# Altium schematic sheet FPGA_Bank13-14.SchDoc: =DocumentName
size A3; DocumentNumber: 1; Revision: 0; SheetNumber: 19; SheetTotal: 30
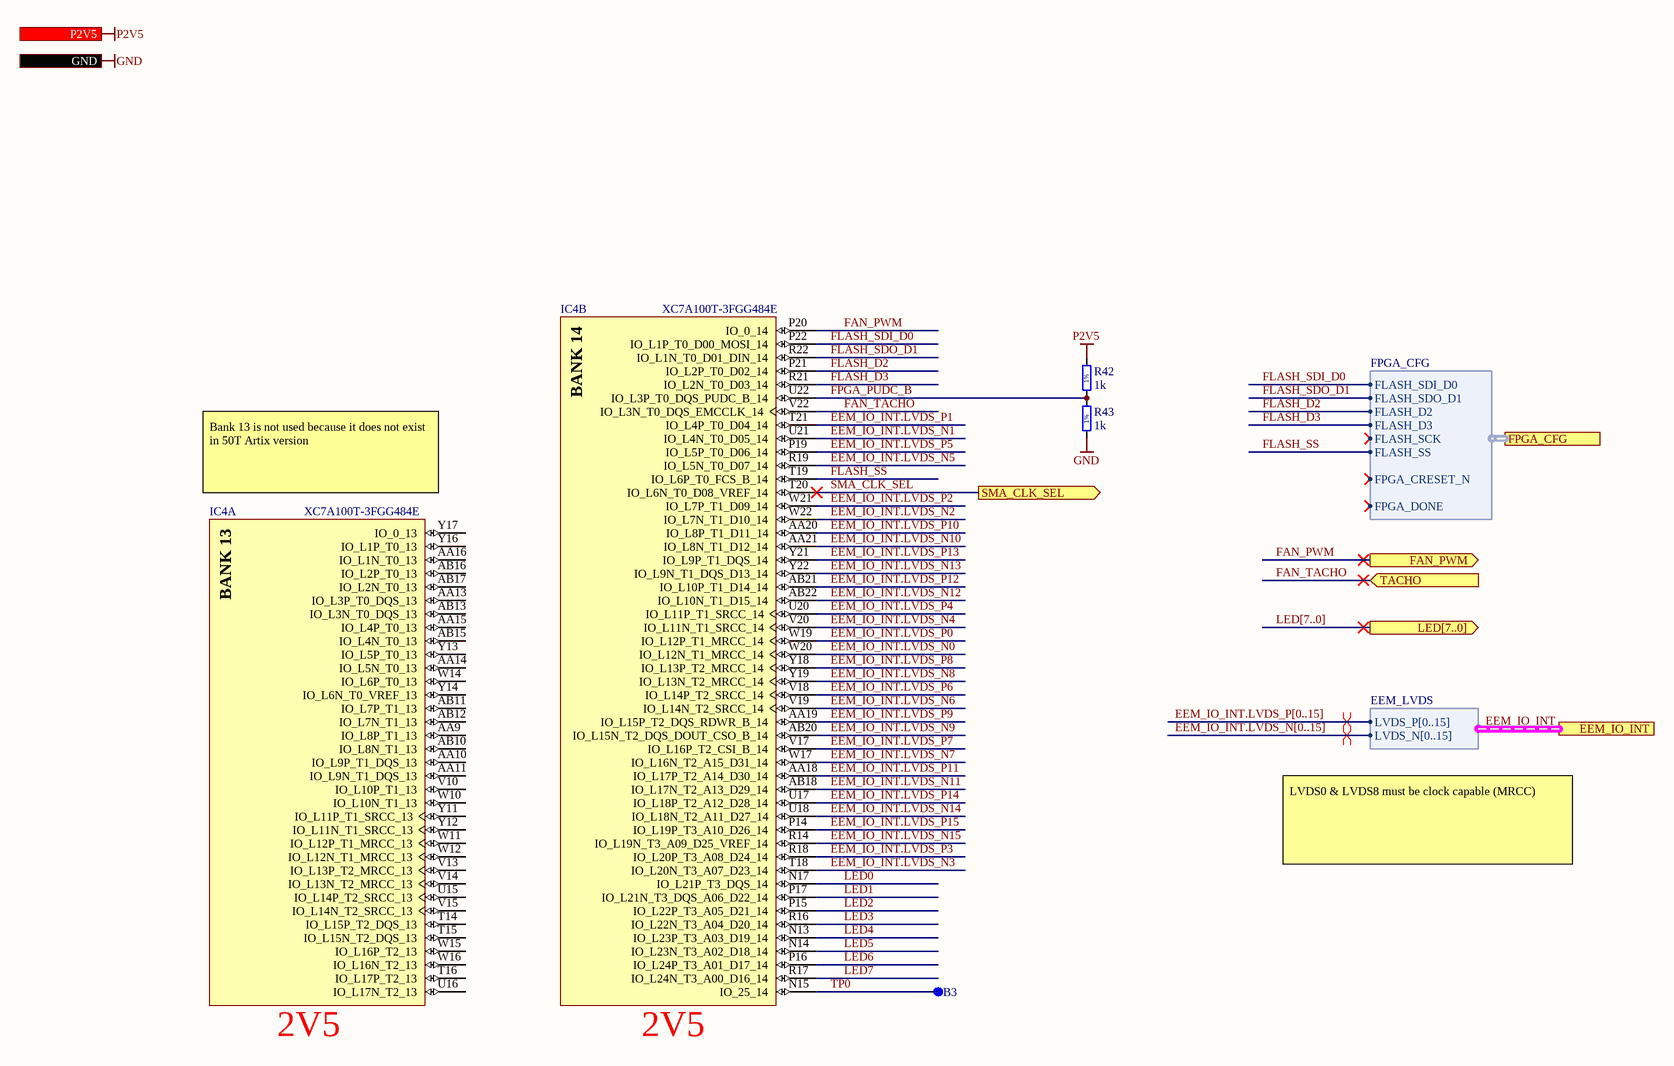
[diagram p0: FPGA_Bank13-14.SchDoc]

## Parts
B3  SMD Pad  [C100]  (value not drawn)
IC4  XC7A100T-3FGG484E  [FGG484]  (parts A,B of 10)
R42  1k  [RESC1005X40N]
R43  1k  [RESC1005X40N]

## Ports
EEM_IO_INT (harness EEM_LVDS), FAN_PWM (out), FPGA_CFG (harness FPGA_CFG), GND, LED[7..0] (out), P2V5 (in), SMA_CLK_SEL (out), TACHO (in)

## Harnesses
EEM_LVDS: LVDS_P[0..15], LVDS_N[0..15]
FPGA_CFG: FLASH_SDI_D0, FLASH_SDO_D1, FLASH_D2, FLASH_D3, FLASH_SCK, FLASH_SS, FPGA_CRESET_N, FPGA_DONE

## Nets
GND: R43.1 ; port GND
P2V5: R42.2 ; port P2V5
EEM_IO_INT.LVDS_N0: IC4.W20(IO_L12N_T1_MRCC_14)
EEM_IO_INT.LVDS_N1: IC4.U21(IO_L4N_T0_D05_14)
EEM_IO_INT.LVDS_N2: IC4.W22(IO_L7N_T1_D10_14)
EEM_IO_INT.LVDS_N3: IC4.T18(IO_L20N_T3_A07_D23_14)
EEM_IO_INT.LVDS_N4: IC4.V20(IO_L11N_T1_SRCC_14)
EEM_IO_INT.LVDS_N5: IC4.R19(IO_L5N_T0_D07_14)
EEM_IO_INT.LVDS_N6: IC4.V19(IO_L14N_T2_SRCC_14)
EEM_IO_INT.LVDS_N7: IC4.W17(IO_L16N_T2_A15_D31_14)
EEM_IO_INT.LVDS_N8: IC4.Y19(IO_L13N_T2_MRCC_14)
EEM_IO_INT.LVDS_N9: IC4.AB20(IO_L15N_T2_DQS_DOUT_CSO_B_14)
EEM_IO_INT.LVDS_N10: IC4.AA21(IO_L8N_T1_D12_14)
EEM_IO_INT.LVDS_N11: IC4.AB18(IO_L17N_T2_A13_D29_14)
EEM_IO_INT.LVDS_N12: IC4.AB22(IO_L10N_T1_D15_14)
EEM_IO_INT.LVDS_N13: IC4.Y22(IO_L9N_T1_DQS_D13_14)
EEM_IO_INT.LVDS_N14: IC4.U18(IO_L18N_T2_A11_D27_14)
EEM_IO_INT.LVDS_N15: IC4.R14(IO_L19N_T3_A09_D25_VREF_14)
EEM_IO_INT.LVDS_P0: IC4.W19(IO_L12P_T1_MRCC_14)
EEM_IO_INT.LVDS_P1: IC4.T21(IO_L4P_T0_D04_14)
EEM_IO_INT.LVDS_P2: IC4.W21(IO_L7P_T1_D09_14)
EEM_IO_INT.LVDS_P3: IC4.R18(IO_L20P_T3_A08_D24_14)
EEM_IO_INT.LVDS_P4: IC4.U20(IO_L11P_T1_SRCC_14)
EEM_IO_INT.LVDS_P5: IC4.P19(IO_L5P_T0_D06_14)
EEM_IO_INT.LVDS_P6: IC4.V18(IO_L14P_T2_SRCC_14)
EEM_IO_INT.LVDS_P7: IC4.V17(IO_L16P_T2_CSI_B_14)
EEM_IO_INT.LVDS_P8: IC4.Y18(IO_L13P_T2_MRCC_14)
EEM_IO_INT.LVDS_P9: IC4.AA19(IO_L15P_T2_DQS_RDWR_B_14)
EEM_IO_INT.LVDS_P10: IC4.AA20(IO_L8P_T1_D11_14)
EEM_IO_INT.LVDS_P11: IC4.AA18(IO_L17P_T2_A14_D30_14)
EEM_IO_INT.LVDS_P12: IC4.AB21(IO_L10P_T1_D14_14)
EEM_IO_INT.LVDS_P13: IC4.Y21(IO_L9P_T1_DQS_14)
EEM_IO_INT.LVDS_P14: IC4.U17(IO_L18P_T2_A12_D28_14)
EEM_IO_INT.LVDS_P15: IC4.P14(IO_L19P_T3_A10_D26_14)
FAN_PWM: IC4.P20(IO_0_14) ; port FAN_PWM
FAN_TACHO: IC4.V22(IO_L3N_T0_DQS_EMCCLK_14) ; port TACHO
FLASH_D2: IC4.P21(IO_L2P_T0_D02_14) ; port FPGA_CFG.FLASH_D2
FLASH_D3: IC4.R21(IO_L2N_T0_D03_14) ; port FPGA_CFG.FLASH_D3
FLASH_SDI_D0: IC4.P22(IO_L1P_T0_D00_MOSI_14) ; port FPGA_CFG.FLASH_SDI_D0
FLASH_SDO_D1: IC4.R22(IO_L1N_T0_D01_DIN_14) ; port FPGA_CFG.FLASH_SDO_D1
FLASH_SS: IC4.T19(IO_L6P_T0_FCS_B_14) ; port FPGA_CFG.FLASH_SS
FPGA_PUDC_B: IC4.U22(IO_L3P_T0_DQS_PUDC_B_14) R42.1 R43.2
LED0: IC4.N17(IO_L21P_T3_DQS_14)
LED1: IC4.P17(IO_L21N_T3_DQS_A06_D22_14)
LED2: IC4.P15(IO_L22P_T3_A05_D21_14)
LED3: IC4.R16(IO_L22N_T3_A04_D20_14)
LED4: IC4.N13(IO_L23P_T3_A03_D19_14)
LED5: IC4.N14(IO_L23N_T3_A02_D18_14)
LED6: IC4.P16(IO_L24P_T3_A01_D17_14)
LED7: IC4.R17(IO_L24N_T3_A00_D16_14)
SMA_CLK_SEL: IC4.T20(IO_L6N_T0_D08_VREF_14) ; port SMA_CLK_SEL
TP0: B3.1 IC4.N15(IO_25_14)

Not connected (* = marked no-connect by the designer): IC4 AA9(IO_L8P_T1_13) AA10(IO_L9P_T1_DQS_13) AA11(IO_L9N_T1_DQS_13) AA13(IO_L3P_T0_DQS_13) AA14(IO_L5N_T0_13) AA15(IO_L4P_T0_13) AA16(IO_L1N_T0_13) AB10(IO_L8N_T1_13) AB11(IO_L7P_T1_13) AB12(IO_L7N_T1_13) AB13(IO_L3N_T0_DQS_13) AB15(IO_L4N_T0_13) AB16(IO_L2P_T0_13) AB17(IO_L2N_T0_13) T14(IO_L15P_T2_DQS_13) T15(IO_L15N_T2_DQS_13) T16(IO_L17P_T2_13) U15(IO_L14P_T2_SRCC_13) U16(IO_L17N_T2_13) V10(IO_L10P_T1_13) V13(IO_L13P_T2_MRCC_13) V14(IO_L13N_T2_MRCC_13) V15(IO_L14N_T2_SRCC_13) W10(IO_L10N_T1_13) W11(IO_L12P_T1_MRCC_13) W12(IO_L12N_T1_MRCC_13) W14(IO_L6P_T0_13) W15(IO_L16P_T2_13) W16(IO_L16N_T2_13) Y11(IO_L11P_T1_SRCC_13) Y12(IO_L11N_T1_SRCC_13) Y13(IO_L5P_T0_13) Y14(IO_L6N_T0_VREF_13) Y16(IO_L1P_T0_13) Y17(IO_0_13)

## Buses and harness runs
bus EEM_IO_INT.LVDS_N[0..15]
bus EEM_IO_INT.LVDS_P[0..15]
bus LED[7..0] = port LED[7..0]
harness EEM_IO_INT = port EEM_IO_INT

## Layout directives
differential pair; differential pair class Diff_100Ohm: (no net found under the mark)

## Notes on the sheet
- (near IC4) Bank 13 is not used because it does not exist in 50T Artix version
- LVDS0 & LVDS8 must be clock capable (MRCC)
- 2V5
- Release
- Last modified =ModifiedDate
  Sheet =sheetnumber of =sheettotal · Size A3
- Copyright =P_copyright_owner
  This source describes Open Hardware and is licensed under the CERN-OHL-W v2. You may redistribute and modify this source and make products using it under the terms of the CERN-OHL-W v2 (https://cern.ch/cern-ohl). This source is distributed WITHOUT ANY EXPRESS OR IMPLIED WARRANTY, INCLUDING OF MERCHANTABILITY, SATISFACTORY QUALITY AND FITNESS FOR A PARTICULAR PURPOSE. Please see the CERN-OHL-W v2 for applicable conditions.
  Notice: If You produce hardware based on this source, You must maintain the Source Location visible on the product, its packaging or its documentation.
- SINARA OPEN HARDWARE
- OPEN HARDWARE FOR SCIENTIFIC INSTRUMENTATION
- https://github.com/sinara-hw
- Release owner
- Designers
- Reviewers
- Source location:
- (in symbol CMP-0364-00028-3, part A) BANK 13
- (in symbol CMP-0364-00028-3, part B) BANK 14
- (in symbol R0402_1K_1%_0.0625W_100PPM) 1%

## Library data of the parts
B3 = SMD_PAD_D1MM: Through Hole Pad; Part Description: 1mm Diameter SMD Pad; Mounted: No; Part Number: SMD_PAD_D1MM; Component Kind: Standard (No BOM); Component Type: Standard (No BOM); Pin Count: 1; Family: SMD Pad; Socket: No; SMD: No; Sense: No; Status: None; ComponentHeight: 0mm; HelpURL: Undefined; Author: CERN DEM JLC; CreateDate: 10.10.2017; LatestRevisionDate: 10.10.2017; PackageDescription: 1mm Diameter SMD Pad
IC4 = CMP-0364-00028-3: Artix-7 FPGA, 285 User I/Os, 4 GTP, 484-Ball BGA, Speed Grade 3, Extended Grade, Pb-Free; Manufacturer: Xilinx; Max User I/O: 300; Clock Mgmt Tiles (CMTs): 6; Logic Cells: 101440; Block RAM Blocks (36Kb): 135; Block RAM Blocks (18Kb): 270; Speed Grade: -3; CLBs (Slices): 15850; Block RAM Blocks (Max Kb): 4860; DSP48E1 Slices: 240; RoHS: Pb-Free; ComponentLink3URL: http://www.xilinx.com/support/documentation/data_sheets/ds181_Artix_7_Data_Sheet.pdf; NexusDeviceID: XC7A100T-3FGG484E; DatasheetVersion: v1.12; Mounting Technology: Surface Mount; PackageDescription: Wire-Bond Fine-Pitch BGA, Body 23 x 23 mm, 1.0 mm Pitch; PackageReference: FGG484; ComponentLink2Description: Package Specification; Code_JEDEC: MS-034-AAJ-1; ComponentLink2URL: http://www.xilinx.com/support/documentation/user_guides/ug475_7Series_Pkg_Pinout.pdf; ComponentLink3Description: DC and Switching Characteristics; Generic Part Number: XC7A100T; ComponentLink4Description: Package File; ComponentLink4URL: http://www.xilinx.com/support/packagefiles/a7packages/xc7a100tfgg484pkg.txt; ComponentLink1URL: http://www.xilinx.com/support/documentation/data_sheets/ds180_7Series_Overview.pdf; PartNumber: XC7A100T-3FGG484E; ComponentLink5URL: http://www.xilinx.com/support/documentation/user_guides/ug475_7Series_Pkg_Pinout.pdf; PackageVersion: Rev 1.8; ComponentLink5Description: Packaging and Pinout; ComponentLink1Description: Datasheet; CLBs (Max Distributed RAM Kb): 1188
R42 R43 = R0402_1K_1%_0.0625W_100PPM: Resistor - 1%; Part Description: General Purpose Thick Film Chip Resistor; Manufacturer: GENERIC; Manufacturer1 Part Number: 232270671002L; TC: ±100ppm/°C; PressFit: No; Part Number: R0402_1K_1%_0.0625W_100PPM; Component Kind: Standard; Component Type: Standard; Pin Count: 2; Value: 1k; Status: Not Recommended; Power: 0.0625W; Tolerance: ±1%; Manufacturer Part Number: R0402_1K_1%_0.0625W_100PPM; Case: 0402; Mounted: Yes; Sense: No; Socket: No; SMD: Yes; Manufacturer1 Example: YAGEO PHYCOMP; Manufacturer1 ComponentHeight: 0.4mm; HelpURL: \\cern.ch\dfs\Applications\Altium\Datasheets\R0402_Phycomp_RC0402.pdf; Author: CERN DEM JLC; CreateDate: 03.12.2007; LatestRevisionDate: 17.10.2012; ClassName: Artix